# Altium schematic sheet Mic_Section.SchDoc
size A4; SheetNumber: 5; SheetTotal: 5
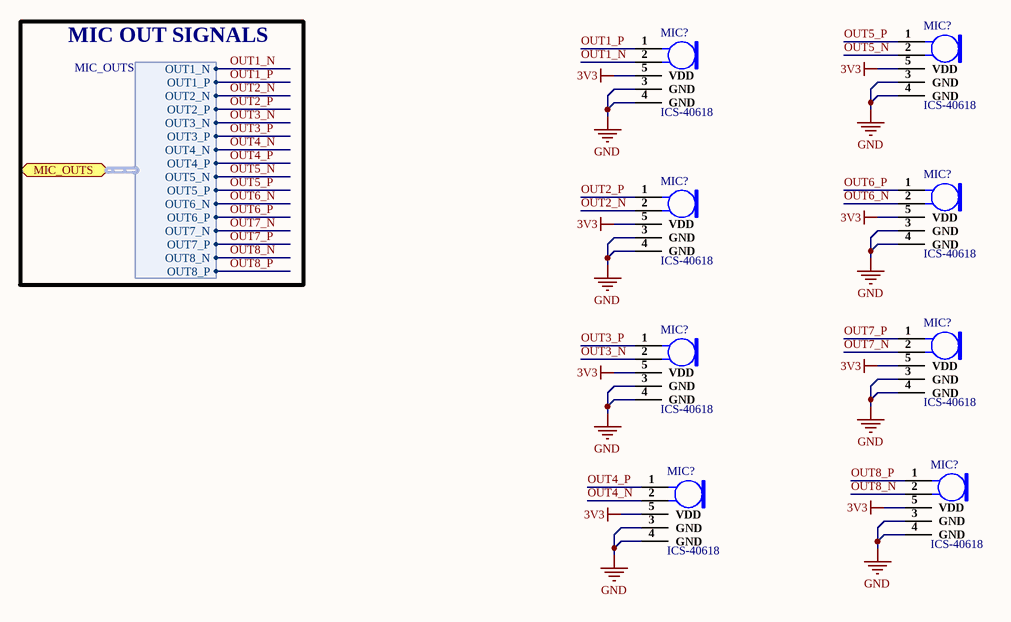
[diagram p0: Mic_Section.SchDoc]

## Parts
(Parts that share a designator on the sheet are numbered #1, #2 ... from top to bottom, then left to right.)
MIC?#1  ICS-40618  [ICS-40618]
MIC?#2  ICS-40618  [ICS-40618]
MIC?#3  ICS-40618  [ICS-40618]
MIC?#4  ICS-40618  [ICS-40618]
MIC?#5  ICS-40618  [ICS-40618]
MIC?#6  ICS-40618  [ICS-40618]
MIC?#7  ICS-40618  [ICS-40618]
MIC?#8  ICS-40618  [ICS-40618]

## Ports
MIC_OUTS (bidir, harness MIC_OUTS)

## Harnesses
MIC_OUTS: OUT1_N, OUT1_P, OUT2_N, OUT2_P, OUT3_N, OUT3_P, OUT4_N, OUT4_P, OUT5_N, OUT5_P, OUT6_N, OUT6_P, OUT7_N, OUT7_P, OUT8_N, OUT8_P

## Nets
3V3: MIC?#1.5(VDD) MIC?#2.5(VDD) MIC?#3.5(VDD) MIC?#4.5(VDD) MIC?#5.5(VDD) MIC?#6.5(VDD) MIC?#7.5(VDD) MIC?#8.5(VDD)
GND: MIC?#1.3(GND) MIC?#1.4(GND) MIC?#2.3(GND) MIC?#2.4(GND) MIC?#3.3(GND) MIC?#3.4(GND) MIC?#4.3(GND) MIC?#4.4(GND) MIC?#5.3(GND) MIC?#5.4(GND) MIC?#6.3(GND) MIC?#6.4(GND) MIC?#7.3(GND) MIC?#7.4(GND) MIC?#8.3(GND) MIC?#8.4(GND)
OUT1_N: MIC?#2.2(OUTPUT-) ; port MIC_OUTS.OUT1_N
OUT1_P: MIC?#2.1(OUTPUT+) ; port MIC_OUTS.OUT1_P
OUT2_N: MIC?#4.2(OUTPUT-) ; port MIC_OUTS.OUT2_N
OUT2_P: MIC?#4.1(OUTPUT+) ; port MIC_OUTS.OUT2_P
OUT3_N: MIC?#6.2(OUTPUT-) ; port MIC_OUTS.OUT3_N
OUT3_P: MIC?#6.1(OUTPUT+) ; port MIC_OUTS.OUT3_P
OUT4_N: MIC?#8.2(OUTPUT-) ; port MIC_OUTS.OUT4_N
OUT4_P: MIC?#8.1(OUTPUT+) ; port MIC_OUTS.OUT4_P
OUT5_N: MIC?#1.2(OUTPUT-) ; port MIC_OUTS.OUT5_N
OUT5_P: MIC?#1.1(OUTPUT+) ; port MIC_OUTS.OUT5_P
OUT6_N: MIC?#3.2(OUTPUT-) ; port MIC_OUTS.OUT6_N
OUT6_P: MIC?#3.1(OUTPUT+) ; port MIC_OUTS.OUT6_P
OUT7_N: MIC?#5.2(OUTPUT-) ; port MIC_OUTS.OUT7_N
OUT7_P: MIC?#5.1(OUTPUT+) ; port MIC_OUTS.OUT7_P
OUT8_N: MIC?#7.2(OUTPUT-) ; port MIC_OUTS.OUT8_N
OUT8_P: MIC?#7.1(OUTPUT+) ; port MIC_OUTS.OUT8_P

## Notes on the sheet
- MIC OUT SIGNALS
- 1
- Huzaifa Ali

## Library data of the parts
MIC?#1-MIC?#8 = ICS-40618: ICS-40618 High SNR Microphone with Differential Output and Low-Power Mode; Manufacturer: TDK InvenSense; Shape: Rectangular; Direction: Omnidirectional; Operating Supply Current: 190uA; Output Type: Analog; Supplier 1: RSComponents; Manufacturer Part Number: ICS-40618; RoHS: No; Category: Microphones; Stock 1: 500; Pricing 1: 200=1.80400, 1000=1.75400, 2500=1.71200, 5000=1.66700 (GBP); Packaging: Tape and Reel; Termination: Solder; RoHS Compliant: No; ComponentLink1URL: https://www.mouser.com/ds/2/400/DS-000044-ICS-40618-v1.0-1115536.pdf?src-supplier=Mouser; ComponentLink1Description: https://www.mouser.com/ds/2/400/DS-000044-ICS-40618-v1.0-1115536.pdf?src-supplier=Mouser; ComponentLink2URL: https://www.invensense.com/wp-content/uploads/2016/02/DS-000044-ICS-40618-v1.0.pdf?src-supplier=Digi-Key; ComponentLink2Description: https://www.invensense.com/wp-content/uploads/2016/02/DS-000044-ICS-40618-v1.0.pdf?src-supplier=Digi-Key; Supplier Part Number 1: 2182224P